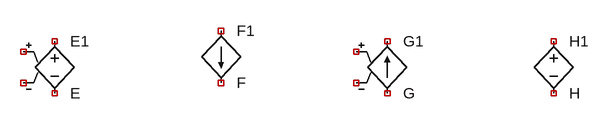
[diagram p0: schematic open_pin_controlled.asc]
open_pin_controlled.asc, the LTspice schematic file:
Version 4
SHEET 1 1200 680
SYMBOL e 0 0 R0
SYMATTR InstName E1
SYMBOL f 256 0 R0
SYMATTR InstName F1
SYMBOL g 512 0 R0
SYMATTR InstName G1
SYMBOL h 768 0 R0
SYMATTR InstName H1

The netlist it stands for:
* open_pin_controlled.asc
E1 NC_01 NC_02 NC_03 NC_04 E
F1 NC_05 NC_06 F
G1 NC_07 NC_08 NC_09 NC_10 G
H1 NC_11 NC_12 H
.backanno
.end